# Altium project Michelin.PrjPcb
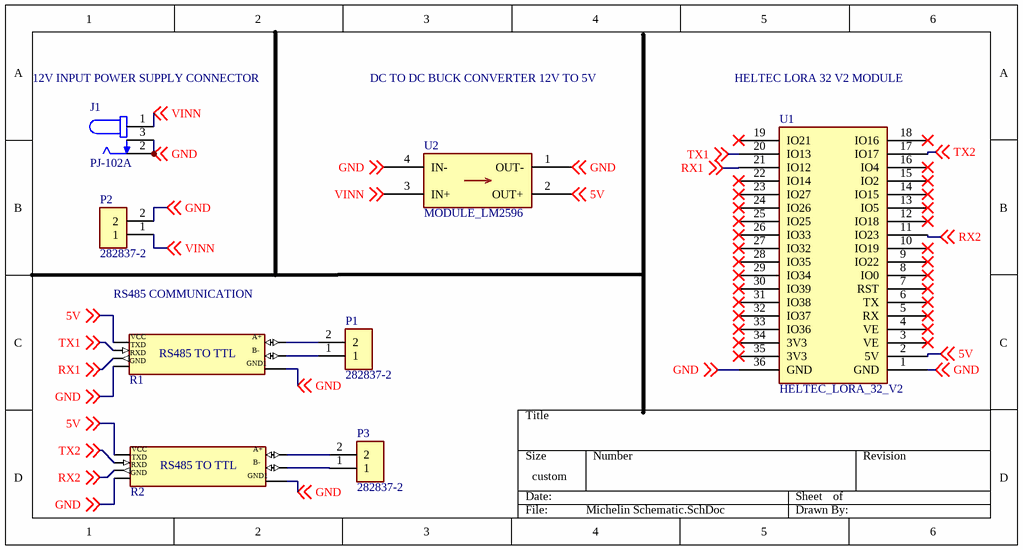
[diagram p0: Michelin Schematic.SchDoc]
1 sheet, 8 parts. Net scope: global (net labels, ports and power ports of the same name join across sheets).
Board file: Michelin PCB BOARD.PcbDoc

## Sheet Michelin Schematic.SchDoc: HELTEC LORA - MODBUS
size 190 x 101 mm; DrawnBy: NITHISHKUMAR; SheetNumber: 1; SheetTotal: 1

### Parts
J1  PJ-102A  [CUI_PJ-102A]
P1  282837-2  [TE_282837-2]
P2  282837-2  [TE_282837-2]
P3  282837-2  [TE_282837-2]
R1  RS485 TO TTL  [RS485 TO TTL]  (value not drawn)
R2  RS485 TO TTL  [RS485 TO TTL]  (value not drawn)
U1  HELTEC_LORA_32_V2  [HELTEC_LORA_32_V2_V3]
U2  MODULE_LM2596  [MODULE_XL4005]

### Nets
5V: R1.VCC R2.VCC U1.2(5V) U2.2(OUT+) ; off-sheet 5V
GND: J1.2 J1.3 P2.2 R1.GND R1.GND1 R2.GND R2.GND1 U1.1(GND) U1.36(GND) U2.1(OUT-) U2.4(IN-) ; off-sheet GND
RX1: R1.RXD U1.21(IO12) ; off-sheet RX1
RX2: R2.RXD U1.11(IO23) ; off-sheet RX2
TX1: R1.TXD U1.20(IO13) ; off-sheet TX1
TX2: R2.TXD U1.17(IO17) ; off-sheet TX2
VINN: J1.1 P2.1 U2.3(IN+) ; off-sheet VINN
NetP1_1: P1.1 R1.B-
NetP1_2: P1.2 R1.A+
NetP3_1: P3.1 R2.B-
NetP3_2: P3.2 R2.A+

Not connected (* = marked no-connect by the designer): U1 3(VE)* 4(VE)* 5(RX)* 6(TX)* 7(RST)* 8(IO0)* 9(IO22)* 10(IO19)* 12(IO18)* 13(IO5)* 14(IO15)* 15(IO2)* 16(IO4)* 18(IO16)* 19(IO21)* 22(IO14)* 23(IO27)* 24(IO26)* 25(IO25)* 26(IO33)* 27(IO32)* 28(IO35)* 29(IO34)* 30(IO39)* 31(IO38)* 32(IO37)* 33(IO36)* 34(3V3)* 35(3V3)*

### Notes on the sheet
- (near J1) 12V INPUT POWER SUPPLY CONNECTOR
- DC TO DC BUCK CONVERTER 12V TO 5V
- HELTEC LORA 32 V2 MODULE
- RS485 COMMUNICATION

### Library data of the parts
J1 = PJ-102A: 2.0 x 6.5 mm, 2.5 A, Horizontal, Through Hole, Tapered Pins, Dc Power Jack Connector; MF: CUI Devices; Price: None; Availability: In Stock; Package: None; MP: PJ-102A; CUI_purchase_URL: https://www.cuidevices.com/product/interconnect/connectors/dc-power-connectors/jacks/pj-102a?utm_source=snapeda.com&utm_medium=referral&utm_campaign=snapedaBOM; Value: *; SnapEDA_Link: https://www.snapeda.com/parts/PJ-102A/CUI+Devices/view-part/?ref=snap; Purchase-URL: https://pricing.snapeda.com/search/part/PJ-102A/?ref=eda; Check_prices: https://www.snapeda.com/parts/PJ-102A/CUI+Devices/view-part/?ref=eda
P1-P3 = 282837-2: 5mm 2Pin Screw Type PCB Terminal Blocks; MF: TE Connectivity; SnapEDA_Link: https://www.snapeda.com/parts/282837-2/TE+Connectivity+AMP+Connectors/view-part/?ref=snap; Price: None; Check_prices: https://www.snapeda.com/parts/282837-2/TE+Connectivity+AMP+Connectors/view-part/?ref=eda; Purchase-URL: https://pricing.snapeda.com/search/part/282837-2/?ref=eda; MP: 282837-2; Value: *; Availability: In Stock; Package: None
U1 = HELTEC_LORA_32_V2: Heltec Lora 32 V2, 36 Pins.
U2 = MODULE_XL4005: MODULE BUCK STEP DOWN 5A 44x21mm; ComponentLink1Description: Datasheet; ComponentLink1URL: https://www.laskakit.cz/user/related_files/xl4005_datasheet.pdf